# Altium project GimbalController.PrjPcb
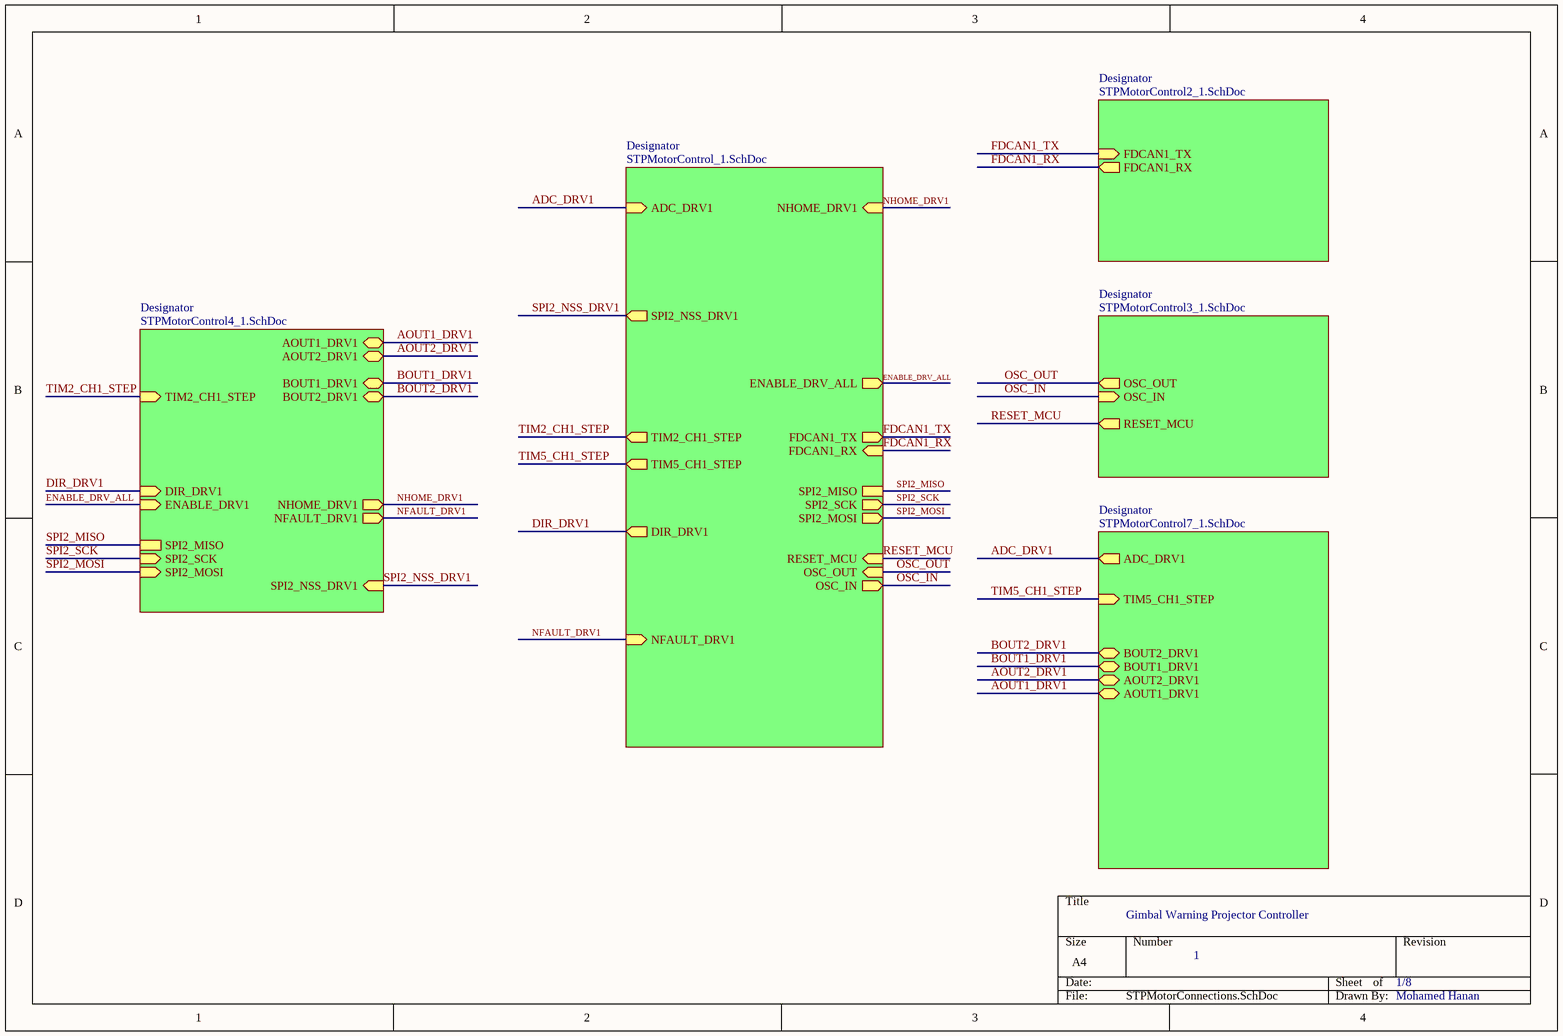
[diagram p0: STPMotorConnections.SchDoc]
6 sheets, 82 parts. Net scope: hierarchical (ports join the sheet entries above them; power ports are global).
Board file: STPMotorControl_1.PcbDoc
Sheets:
  STPMotorConnections.SchDoc
    Designator = STPMotorControl_1.SchDoc
    Designator = STPMotorControl2_1.SchDoc
    Designator = STPMotorControl3_1.SchDoc
    Designator = STPMotorControl4_1.SchDoc
    Designator = STPMotorControl7_1.SchDoc

## Sheet STPMotorConnections.SchDoc
size A4; SheetNumber: 1; SheetTotal: 6

### Sub-sheets
Designator = STPMotorControl_1.SchDoc: TIM2_CH1_STEP (out), TIM5_CH1_STEP (out), DIR_DRV1 (out), NFAULT_DRV1 (in), NHOME_DRV1 (in), ENABLE_DRV_ALL (out), FDCAN1_TX (out), FDCAN1_RX (in), SPI2_MISO, SPI2_SCK (out), SPI2_MOSI (out), RESET_MCU (in), OSC_OUT (in), OSC_IN (out), ADC_DRV1 (in), SPI2_NSS_DRV1 (out)
Designator = STPMotorControl2_1.SchDoc: FDCAN1_TX (in), FDCAN1_RX (out)
Designator = STPMotorControl3_1.SchDoc: OSC_OUT (out), OSC_IN (in), RESET_MCU (out)
Designator = STPMotorControl4_1.SchDoc: AOUT1_DRV1 (bidir), AOUT2_DRV1 (bidir), BOUT1_DRV1 (bidir), BOUT2_DRV1 (bidir), NHOME_DRV1 (out), NFAULT_DRV1 (out), SPI2_MISO, SPI2_SCK (in), SPI2_MOSI (in), DIR_DRV1 (in), ENABLE_DRV1 (in), TIM2_CH1_STEP (in), SPI2_NSS_DRV1 (in)
Designator = STPMotorControl7_1.SchDoc: BOUT2_DRV1 (bidir), BOUT1_DRV1 (bidir), AOUT2_DRV1 (bidir), AOUT1_DRV1 (bidir), ADC_DRV1 (out), TIM5_CH1_STEP (in)

### Nets
ADC_DRV1: sheet Designator/ADC_DRV1, sheet Designator/ADC_DRV1
AOUT1_DRV1: sheet Designator/AOUT1_DRV1, sheet Designator/AOUT1_DRV1
AOUT2_DRV1: sheet Designator/AOUT2_DRV1, sheet Designator/AOUT2_DRV1
BOUT1_DRV1: sheet Designator/BOUT1_DRV1, sheet Designator/BOUT1_DRV1
BOUT2_DRV1: sheet Designator/BOUT2_DRV1, sheet Designator/BOUT2_DRV1
DIR_DRV1: sheet Designator/DIR_DRV1, sheet Designator/DIR_DRV1
ENABLE_DRV_ALL: sheet Designator/ENABLE_DRV_ALL, sheet Designator/ENABLE_DRV1
FDCAN1_RX: sheet Designator/FDCAN1_RX, sheet Designator/FDCAN1_RX
FDCAN1_TX: sheet Designator/FDCAN1_TX, sheet Designator/FDCAN1_TX
NFAULT_DRV1: sheet Designator/NFAULT_DRV1, sheet Designator/NFAULT_DRV1
NHOME_DRV1: sheet Designator/NHOME_DRV1, sheet Designator/NHOME_DRV1
OSC_IN: sheet Designator/OSC_IN, sheet Designator/OSC_IN
OSC_OUT: sheet Designator/OSC_OUT, sheet Designator/OSC_OUT
RESET_MCU: sheet Designator/RESET_MCU, sheet Designator/RESET_MCU  [project net RESET]
SPI2_MISO: sheet Designator/SPI2_MISO, sheet Designator/SPI2_MISO
SPI2_MOSI: sheet Designator/SPI2_MOSI, sheet Designator/SPI2_MOSI
SPI2_NSS_DRV1: sheet Designator/SPI2_NSS_DRV1, sheet Designator/SPI2_NSS_DRV1
SPI2_SCK: sheet Designator/SPI2_SCK, sheet Designator/SPI2_SCK
TIM2_CH1_STEP: sheet Designator/TIM2_CH1_STEP, sheet Designator/TIM2_CH1_STEP
TIM5_CH1_STEP: sheet Designator/TIM5_CH1_STEP, sheet Designator/TIM5_CH1_STEP

### Notes on the sheet
- Gimbal Warning Projector Controller
- 1
- 1/8
- Mohamed Hanan

## Sheet STPMotorControl_1.SchDoc
size A4; SheetNumber: 2; SheetTotal: 6
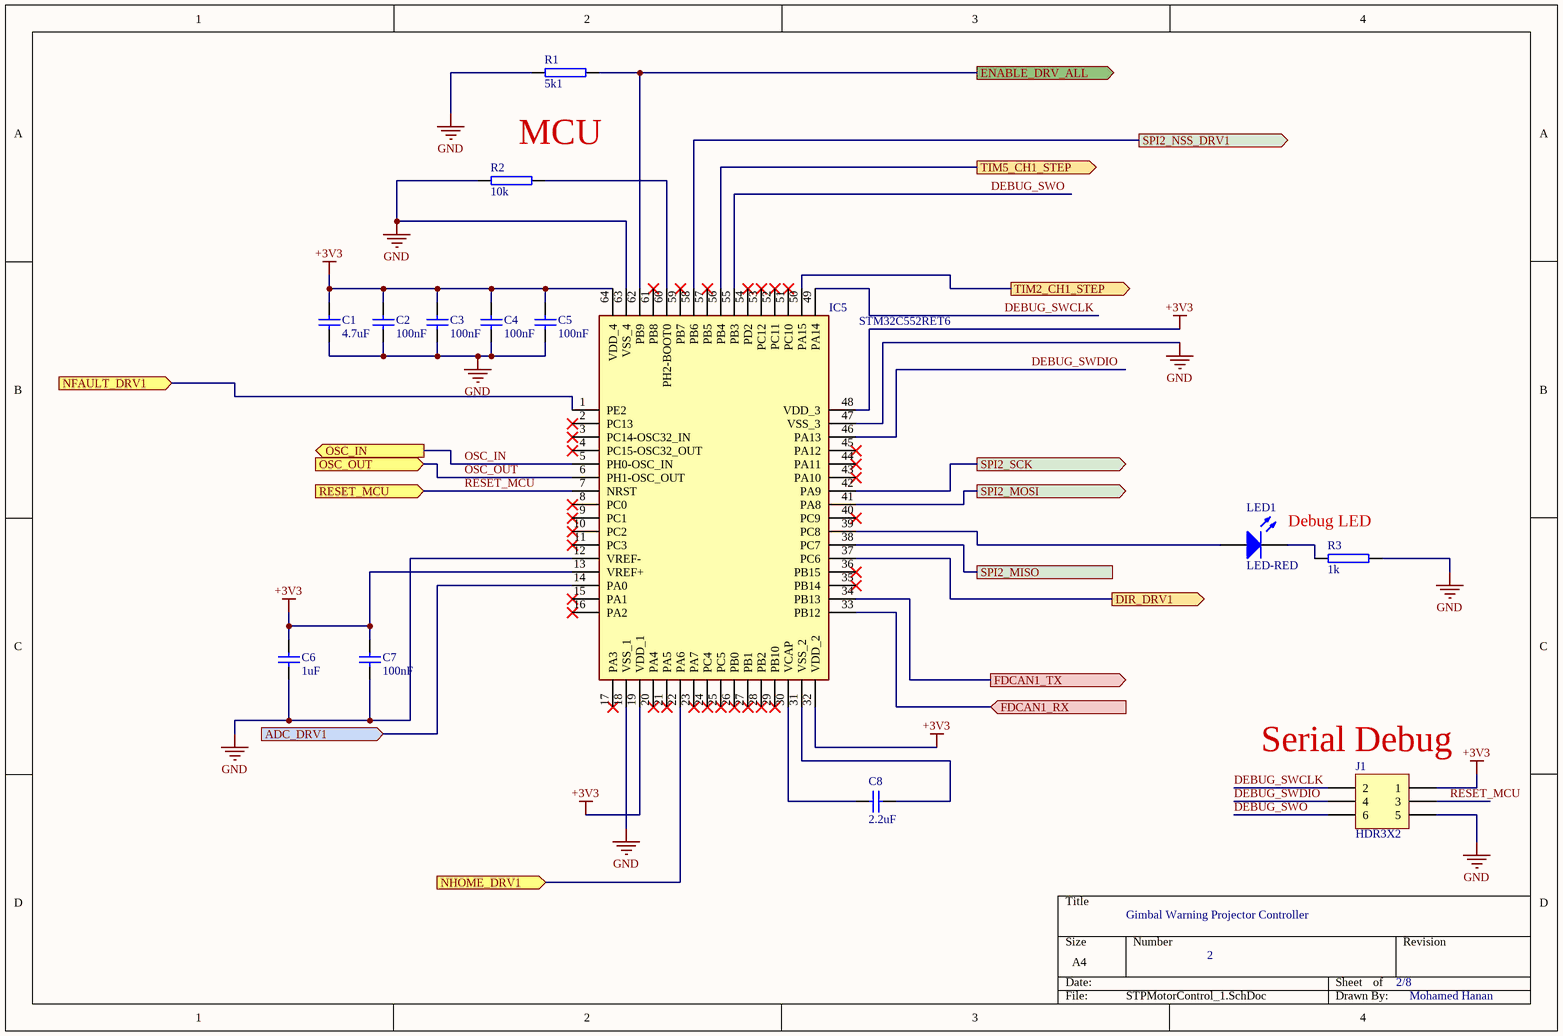
[diagram p1: STPMotorControl_1.SchDoc]

### Parts
C1  4.7uF  [CAP_1206]
C2  100nF  [CAP_0805]
C3  100nF  [CAP_0805]
C4  100nF  [CAP_0805]
C5  100nF  [CAP_0805]
C6  1uF  [CAP_0805]
C7  100nF  [CAP_0805]
C8  2.2uF  [CAP_0805]
IC5  STM32C552RET6  [QFP50P1200X1200X160-64N]
J1  HDR3X2  [HDR2X3_AUT]
LED1  LED-RED  [LED1206R]
R1  5k1  [RES_0805]
R2  10k  [RES_0805]
R3  1k  [RES_1206]

### Ports
ADC_DRV1 (in, see STPMotorConnections[2A], STPMotorControl7_1[1A]), DIR_DRV1 (out, see STPMotorConnections[2C], STPMotorControl4_1[2B]), ENABLE_DRV_ALL (out, see STPMotorConnections[3B]), FDCAN1_RX (in, see STPMotorConnections[3B], STPMotorControl2_1[1B]), FDCAN1_TX (out, see STPMotorConnections[3B], STPMotorControl2_1[2B]), NFAULT_DRV1 (in, see STPMotorConnections[2C], STPMotorControl4_1[2C]), NHOME_DRV1 (in, see STPMotorConnections[3A], STPMotorControl4_1[2C]), OSC_IN (out, see STPMotorConnections[3C], STPMotorControl3_1[1C]), OSC_OUT (in, see STPMotorConnections[3C], STPMotorControl3_1[2B]), RESET_MCU (in, see STPMotorConnections[3C], STPMotorControl3_1[1D]), SPI2_MISO (see STPMotorConnections[3B], STPMotorControl4_1[3C]), SPI2_MOSI (out, see STPMotorConnections[3C], STPMotorControl4_1[3C]), SPI2_NSS_DRV1 (out, see STPMotorConnections[2B], STPMotorControl4_1[2B]), SPI2_SCK (out, see STPMotorConnections[3B], STPMotorControl4_1[3C]), TIM2_CH1_STEP (out, see STPMotorConnections[2B], STPMotorControl4_1[3B]), TIM5_CH1_STEP (out, see STPMotorConnections[2B], STPMotorControl7_1[1B])

### Nets
+3V3: C1.2 C2.2 C3.2 C4.2 C5.2 C6.2 C7.2 IC5.13(VREF+) IC5.19(VDD_1) IC5.32(VDD_2) IC5.48(VDD_3) IC5.64(VDD_4) J1.1
GND: C1.1 C2.1 C3.1 C4.1 C5.1 C6.1 C7.1 IC5.12(VREF-) IC5.18(VSS_1) IC5.47(VSS_3) IC5.63(VSS_4) J1.5 R1.1 R2.1 R3.2
ADC_DRV1: IC5.14(PA0) ; port ADC_DRV1
DEBUG_SWCLK: IC5.49(PA14) J1.2
DEBUG_SWDIO: IC5.46(PA13) J1.4
DEBUG_SWO: IC5.55(PB3) J1.6
DIR_DRV1: IC5.37(PC6) ; port DIR_DRV1
ENABLE_DRV_ALL: IC5.62(PB9) R1.2 ; port ENABLE_DRV_ALL
FDCAN1_RX: IC5.33(PB12) ; port FDCAN1_RX
FDCAN1_TX: IC5.34(PB13) ; port FDCAN1_TX
NFAULT_DRV1: IC5.1(PE2) ; port NFAULT_DRV1
NHOME_DRV1: IC5.22(PA6) ; port NHOME_DRV1
OSC_IN: IC5.5(PH0-OSC_IN) ; port OSC_IN
OSC_OUT: IC5.6(PH1-OSC_OUT) ; port OSC_OUT
RESET_MCU: IC5.7(NRST) J1.3 ; port RESET_MCU  [project net RESET]
SPI2_MISO: IC5.38(PC7) ; port SPI2_MISO
SPI2_MOSI: IC5.41(PA8) ; port SPI2_MOSI
SPI2_NSS_DRV1: IC5.58(PB6) ; port SPI2_NSS_DRV1
SPI2_SCK: IC5.42(PA9) ; port SPI2_SCK
TIM2_CH1_STEP: IC5.50(PA15) ; port TIM2_CH1_STEP
TIM5_CH1_STEP: IC5.56(PB4) ; port TIM5_CH1_STEP
NetC8_1: C8.1 IC5.30(VCAP)
NetC8_2: C8.2 IC5.31(VSS_2)
NetIC5_39: IC5.39(PC8) LED1.A
NetIC5_60: IC5.60(PH2-BOOT0) R2.2
NetLED1_K: LED1.K R3.1

Not connected (* = marked no-connect by the designer): IC5 2(PC13)* 3(PC14-OSC32_IN)* 4(PC15-OSC32_OUT)* 8(PC0)* 9(PC1)* 10(PC2)* 11(PC3)* 15(PA1)* 16(PA2)* 17(PA3)* 20(PA4)* 21(PA5)* 23(PA7)* 24(PC4)* 25(PC5)* 26(PB0)* 27(PB1)* 28(PB2)* 29(PB10)* 35(PB14)* 36(PB15)* 40(PC9)* 43(PA10)* 44(PA11)* 45(PA12)* 51(PC10)* 52(PC11)* 53(PC12)* 54(PD2)* 57(PB5)* 59(PB7)* 61(PB8)*

### Notes on the sheet
- MCU
- Debug LED
- (near J1) Serial Debug
- Gimbal Warning Projector Controller
- 2
- 2/8
- Mohamed Hanan

### Library data of the parts
C1 = CAPN 1206: Non Polarized Capacitor, SMD, 1206
C2-C8 = CAPN 0805: Non Polarized Capacitor, SMD, 0805
IC5 = STM32C552RET6: Integrated Circuit; Manufacturer_Name: STMicroelectronics; Datasheet Link: https://www.st.com/resource/en/datasheet/stm32c551cc.pdf; Height: 1.6mm; Manufacturer_Part_Number: STM32C552RET6
J1 = HDR3X2: Header, 3-Pin, Dual row, 2.54mm Pitch, Straight; Supplier 1: Farnell; Supplier Part Number 1: 9733574
LED1 = SMD 1206 LED-RED: RED LED, Case 1206; Supplier 1: Farnell; Supplier Part Number 1: 8530017
R1 R2 = Resistor 0805: Resistor, SMD, 0805
R3 = Resistor 1206: Resistor, SMD, 1206

## Sheet STPMotorControl2_1.SchDoc
size A4; SheetNumber: 3; SheetTotal: 6
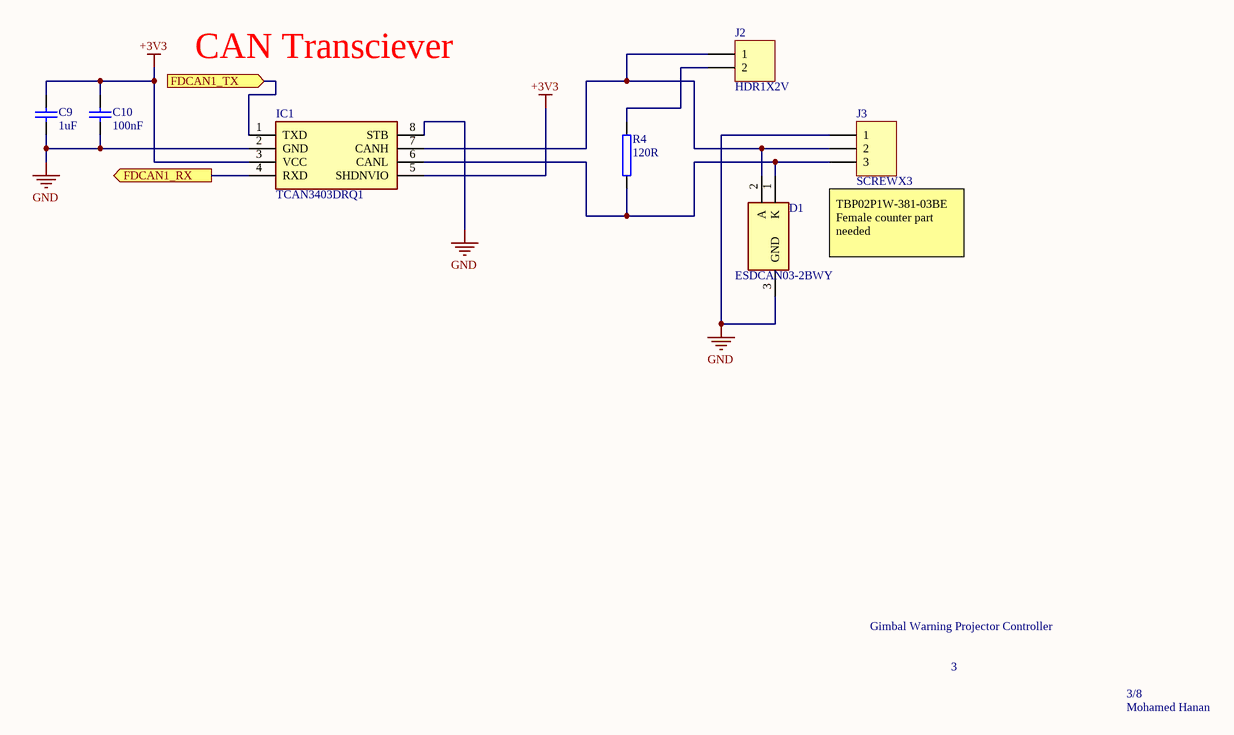
[diagram p2: STPMotorControl2_1.SchDoc]

### Parts
C9  1uF  [CAP_0805]
C10  100nF  [CAP_0805]
D1  ESDCAN03-2BWY  [SOT65P210X110-3N]
IC1  TCAN3403DRQ1  [SOIC127P600X175-8N]
J2  HDR1X2V  [HDR1X2_AUT]
J3  SCREWX3  [SCREW3_AUT]
R4  120R  [RES_1206]

### Ports
FDCAN1_RX (out, see STPMotorConnections[3A], STPMotorControl_1[3C]), FDCAN1_TX (in, see STPMotorConnections[3A], STPMotorControl_1[3C])

### Nets
+3V3: C9.2 C10.2 IC1.3(VCC) IC1.5(SHDNVIO)
GND: C9.1 C10.1 D1.3(GND) IC1.2(GND) IC1.8(STB) J3.1
FDCAN1_RX: IC1.4(RXD) ; port FDCAN1_RX
FDCAN1_TX: IC1.1(TXD) ; port FDCAN1_TX
NetD1_1: D1.1(K) IC1.6(CANL) J3.3 R4.1
NetD1_2: D1.2(A) IC1.7(CANH) J2.1 J3.2
NetJ2_2: J2.2 R4.2

### Notes on the sheet
- CAN Transciever
- (near J3) TBP02P1W-381-03BE
  Female counter part needed
- Gimbal Warning Projector Controller
- 3
- 3/8
- Mohamed Hanan

### Library data of the parts
C9 C10 = CAPN 0805: Non Polarized Capacitor, SMD, 0805
D1 = ESDCAN03-2BWY: TVS Diode (Uni-directional); Manufacturer_Name: STMicroelectronics; Datasheet Link: https://www.st.com/resource/en/datasheet/esdcan03-2bwy.pdf; Height: 1.1mm; Manufacturer_Part_Number: ESDCAN03-2BWY; Mouser Part Number: 511-ESDCAN03-2BWY; Mouser Price/Stock: https://www.mouser.co.uk/ProductDetail/STMicroelectronics/ESDCAN03-2BWY?qs=FqY30PPN9V2iiokjuqa22Q%3D%3D; Arrow Part Number: ESDCAN03-2BWY; Arrow Price/Stock: https://www.arrow.com/en/products/esdcan03-2bwy/stmicroelectronics.html?utm_currency=USD&region=europe
IC1 = TCAN3403DRQ1: Integrated Circuit; Manufacturer_Name: Texas Instruments; Datasheet Link: https://www.ti.com/lit/ds/symlink/tcan3403-q1.pdf?ts=1732780388772&ref_url=https%253A%252F%252Fwww.ti.com%252Fproduct%252FTCAN3403-Q1%252Fpart-details%252FTCAN3403DRQ1; Height: 1.75mm; Manufacturer_Part_Number: TCAN3403DRQ1; Mouser Part Number: 595-TCAN3403DRQ1; Mouser Price/Stock: https://www.mouser.co.uk/ProductDetail/Texas-Instruments/TCAN3403DRQ1?qs=VVKQmw408U8i3BeOClYB9g%3D%3D; Arrow Part Number: TCAN3403DRQ1; Arrow Price/Stock: https://www.arrow.com/en/products/tcan3403drq1/texas-instruments?utm_currency=USD&region=nac
J2 = HDR1X2V: Header, Plug, 2.54mm, 2 Pins, Straight; Supplier 1: Farnell; Supplier Part Number 1: 2254030
J3 = SCREWX3: Terminal Block, PCB, 3Way, Pitch 5mm; Supplier 1: Farnell; Supplier Part Number 1: 9632689
R4 = Resistor 1206: Resistor, SMD, 1206

## Sheet STPMotorControl3_1.SchDoc
size A4; SheetNumber: 4; SheetTotal: 6
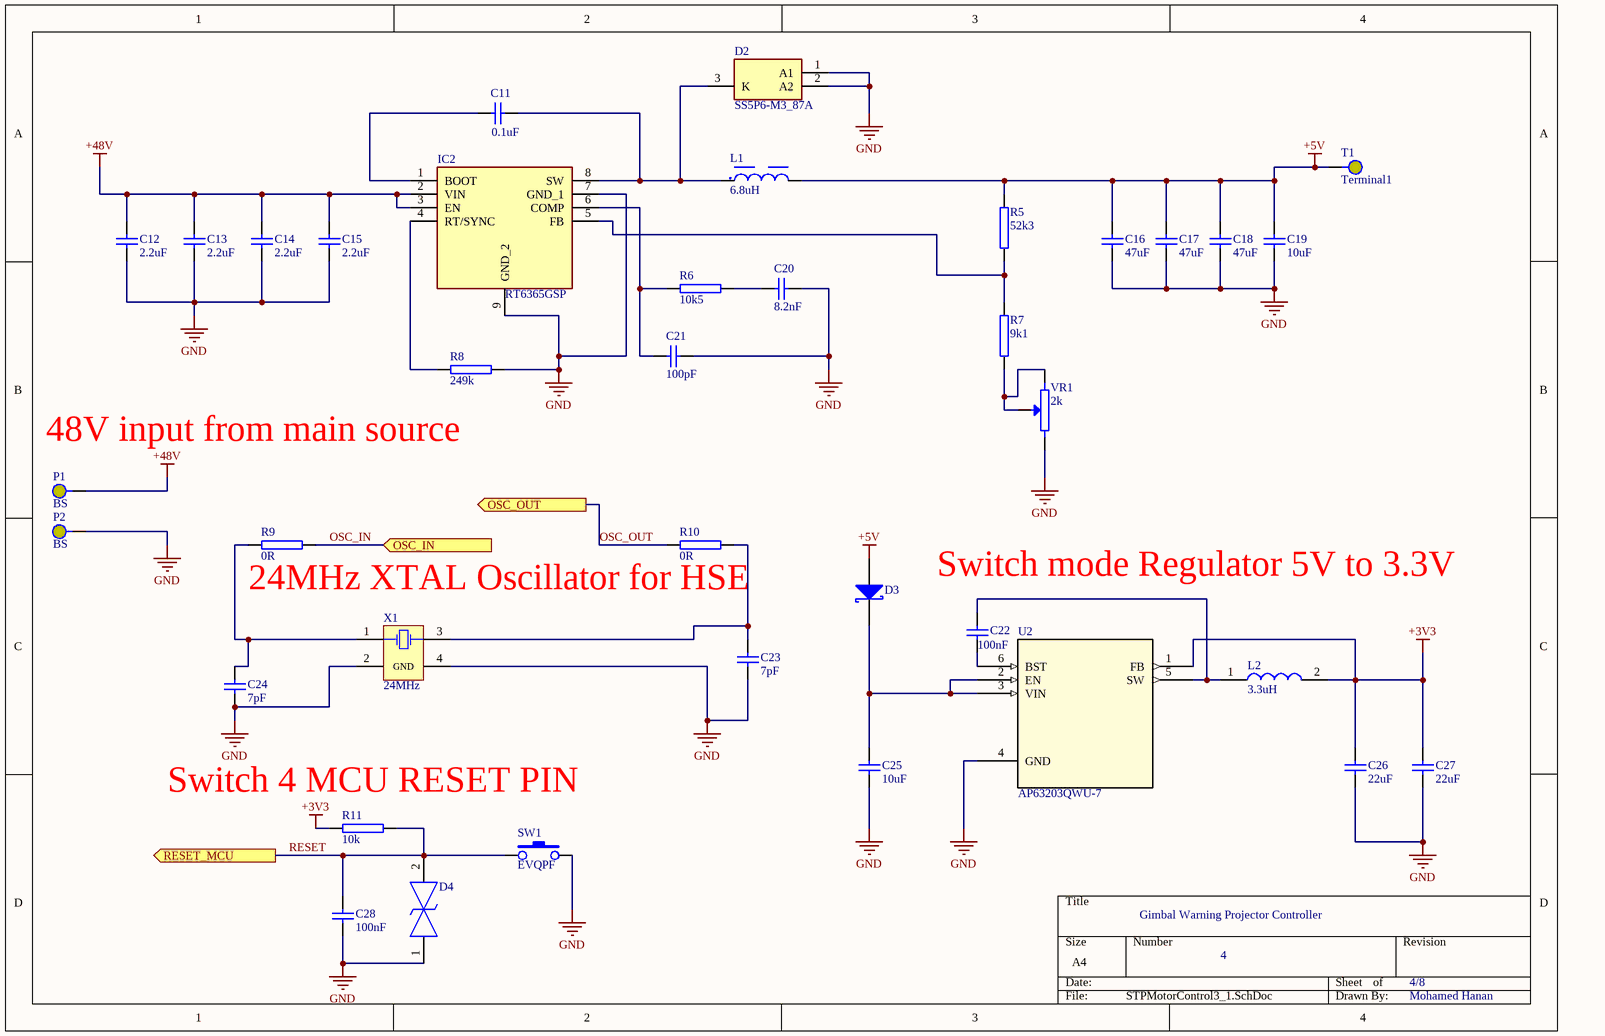
[diagram p3: STPMotorControl3_1.SchDoc]

### Parts
C11  0.1uF  [CAP_1206]
C12  2.2uF  [CAP_0805]
C13  2.2uF  [CAP_0805]
C14  2.2uF  [CAP_0805]
C15  2.2uF  [CAP_0805]
C16  47uF  [CAP_1206]
C17  47uF  [CAP_1206]
C18  47uF  [CAP_1206]
C19  10uF  [CAP_1206]
C20  8.2nF  [CAP_1206]
C21  100pF  [CAP_0805]
C22  100nF  [CAP_0805]
C23  7pF  [CAP_0805]
C24  7pF  [CAP_0805]
C25  10uF  [CAP_1206]
C26  22uF  [CAP_1206]
C27  22uF  [CAP_1206]
C28  100nF  [CAP_0805]
D2  SS5P6-M3_87A  [SS5P6M387A]
D3  PMEG3050BEP  [SOD-128]  (value not drawn)
D4  TSD05CDYFR  [SOD2613X100N]  (value not drawn)
IC2  RT6365GSP  [SOIC127P600X175-9N]
L1  6.8uH  [WE-LHMI_7050]
L2  3.3uH  [SRP4020TA3R3M]
P1  BS  [Banana_AUT]
P2  BS  [Banana_AUT]
R5  52k3  [RES_0805]
R6  10k5  [RES_0805]
R7  9k1  [RES_0805]
R8  249k  [RES_1206]
R9  0R  [RES_0805]
R10  0R  [RES_0805]
R11  10k  [RES_0805]
SW1  EVQPF  [EVQPF203M]
T1  Terminal1  [PAD1_AUT]
U2  AP63203QWU-7  [TSOT26_DIO]
VR1  2k  [3362S]
X1  24MHz  [CX2520SB]

### Ports
OSC_IN (in, see STPMotorConnections[3B], STPMotorControl_1[1B]), OSC_OUT (out, see STPMotorConnections[3B], STPMotorControl_1[1B]), RESET_MCU (out, see STPMotorConnections[3B], STPMotorControl_1[1B])

### Nets
+3V3: C26.2 C27.2 L2.2 R11.2 U2.1(FB)
+5V: C16.2 C17.2 C18.2 C19.2 D3.A L1.2 R5.2 T1.1
+48V: C12.2 C13.2 C14.2 C15.2 IC2.2(VIN) IC2.3(EN) P1.1
GND: C12.1 C13.1 C14.1 C15.1 C16.1 C17.1 C18.1 C19.1 C20.2 C21.2 C23.2 C24.2 C25.1 C26.1 C27.1 C28.1 D2.1(A1) D2.2(A2) D4.1 IC2.7(GND_1) IC2.9(GND_2) P2.1 R8.2 SW1.2 U2.4(GND) VR1.2(BOT) X1.2(GND) X1.4(GND)
OSC_IN: R9.2 ; port OSC_IN
OSC_OUT: R10.1 ; port OSC_OUT
RESET: C28.2 D4.2 R11.1 SW1.1 ; port RESET_MCU
NetC11_1: C11.1 IC2.1(BOOT)
NetC11_2: C11.2 D2.3(K) IC2.8(SW) L1.1
NetC20_1: C20.1 R6.2
NetC21_1: C21.1 IC2.6(COMP) R6.1
NetC22_1: C22.1 U2.6(BST)
NetC22_2: C22.2 L2.1 U2.5(SW)
NetC23_1: C23.1 R10.2 X1.3(OSC2)
NetC24_1: C24.1 R9.1 X1.1(OSC1)
NetC25_2: C25.2 D3.K U2.2(EN) U2.3(VIN)
NetIC2_4: IC2.4(RT/SYNC) R8.1
NetIC2_5: IC2.5(FB) R5.1 R7.2
NetR7_1: R7.1 VR1.1(TOP) VR1.W(TAP)

### Notes on the sheet
- 48V input from main source
- (near C22) Switch mode Regulator 5V to 3.3V
- 24MHz XTAL Oscillator for HSE
- (near R11) Switch 4 MCU RESET PIN
- Gimbal Warning Projector Controller
- 4
- 4/8
- Mohamed Hanan

### Library data of the parts
C11 C16-C20 C25-C27 = CAPN 1206: Non Polarized Capacitor, SMD, 1206
C12-C15 C21-C24 C28 = CAPN 0805: Non Polarized Capacitor, SMD, 0805
D2 = SS5P6-M3_87A: Schottky Diode; Manufacturer_Name: Vishay; Manufacturer_Part_Number: SS5P6-M3/87A; Datasheet Link: https://www.vishay.com/docs/88988/ss5p6.pdf; Height: 1.2mm; Mouser Part Number: 625-SS5P6-M3/87A; Mouser Price/Stock: https://www.mouser.co.uk/ProductDetail/Vishay-General-Semiconductor/SS5P6-M3-87A?qs=XGzIaZb%2FFYLx0h%2FWoI%2FVUQ%3D%3D; Arrow Part Number: SS5P6-M3/87A; Arrow Price/Stock: https://www.arrow.com/en/products/ss5p6-m387a/vishay?utm_currency=USD&region=nac
D3 = PMEG3050BEP: Schottky REC, 30V, 5A, SMD; Supplier 1: Farnell; Supplier Part Number 1: 1829196
D4 = TSD05CDYFR: TVS Diode (Bi-directional); Manufacturer_Name: Texas Instruments; Datasheet Link: https://www.ti.com/lit/ds/symlink/tsd05c.pdf?ts=1691730725852&ref_url=https%253A%252F%252Fwww.ti.com%252Fproduct%252FTSD05C%253FkeyMatch%253DTSD05CDYFR%2526tisearch%253Dsearch-everything%2526usecase%253DOPN; Height: 1mm; Manufacturer_Part_Number: TSD05CDYFR; Mouser Part Number: 595-TSD05CDYFR; Mouser Price/Stock: https://www.mouser.co.uk/ProductDetail/Texas-Instruments/TSD05CDYFR?qs=Imq1NPwxi74wAiGFX0POZQ%3D%3D; Arrow Part Number: TSD05CDYFR; Arrow Price/Stock: https://www.arrow.com/en/products/tsd05cdyfr/texas-instruments.html?utm_currency=USD&region=nac
IC2 = RT6365GSP: Integrated Circuit; Manufacturer_Name: RICHTEK; Datasheet Link: https://www.richtek.com/assets/product_file/RT6365/DS6365-02.pdf; Height: 1.753mm; Manufacturer_Part_Number: RT6365GSP; Mouser Part Number: 835-RT6365GSP; Mouser Price/Stock: https://www.mouser.co.uk/ProductDetail/Richtek/RT6365GSP?qs=amGC7iS6iy%252BGHkAL3RFUug%3D%3D
L1 = WE-LHMI_7050: Power Inductor, 6.8Uh, Shielded, 6.6A Rohs Compliant: Yes |Wurth Elektronik 7443734948068; MF: Wurth Electronics; SnapEDA_Link: https://www.snapeda.com/parts/7443734948068/Wurth+Electronics/view-part/?ref=snap; Package: None; Value: *; MP: 7443734948068; Check_prices: https://www.snapeda.com/parts/7443734948068/Wurth+Electronics/view-part/?ref=eda
L2 = SRP4020TA-3R3M: Inductor; Manufacturer_Name: Bourns; Datasheet Link: https://www.bourns.com/docs/Product-Datasheets/SRP4020TA.pdf; Height: 2mm; Manufacturer_Part_Number: SRP4020TA-3R3M; Mouser Part Number: 652-SRP4020TA-3R3M; Mouser Price/Stock: https://www.mouser.co.uk/ProductDetail/Bourns/SRP4020TA-3R3M?qs=Ph8%2FHnX6CQx4K7XcRwo6CA%3D%3D; Arrow Part Number: SRP4020TA-3R3M; Arrow Price/Stock: https://www.arrow.com/en/products/srp4020ta-3r3m/bourns?region=nac
P1 P2 = Banana Socket: Banana Socket, 4mm, Panel, Black, 10A; Supplier 1: Farnell; Supplier Part Number 1: 1101113
R5-R7 R9-R11 = Resistor 0805: Resistor, SMD, 0805
R8 = Resistor 1206: Resistor, SMD, 1206
SW1 = EVQPF: PANASONIC  EVQPF203M  SWITCH, TACTILE, SPST-NO, 20mA, 15VDC; Supplier 1: Farnell; Supplier Part Number 1: 2079505
T1 = Terminal1: Terminal, Pad 70x70mil, Hole 32 mil
U2 = AP63203QWU-7: Description; Manufacturer_Name: Diodes Inc; Type: Power Management; Copyright: Copyright (C) 2026 Ultra Librarian. All rights reserved.; Manufacturer_Part_Number: AP63203QWU-7; RefDes: RefDes
VR1 = 3362S-1-202LF: 3362S Series, 1/4 ” Square  Potentiometer, 2k, 10%, 0.5 Watts, 1Turn; Supplier 1: Farnell; Supplier Part Number 1: 2321842
X1 = CX2520SB24000D0FLJZZ: Crystals, 24MHz; Supplier 1: Farnell; Supplier Part Number 1: 1657889

## Sheet STPMotorControl4_1.SchDoc
size A4; SheetNumber: 5; SheetTotal: 6
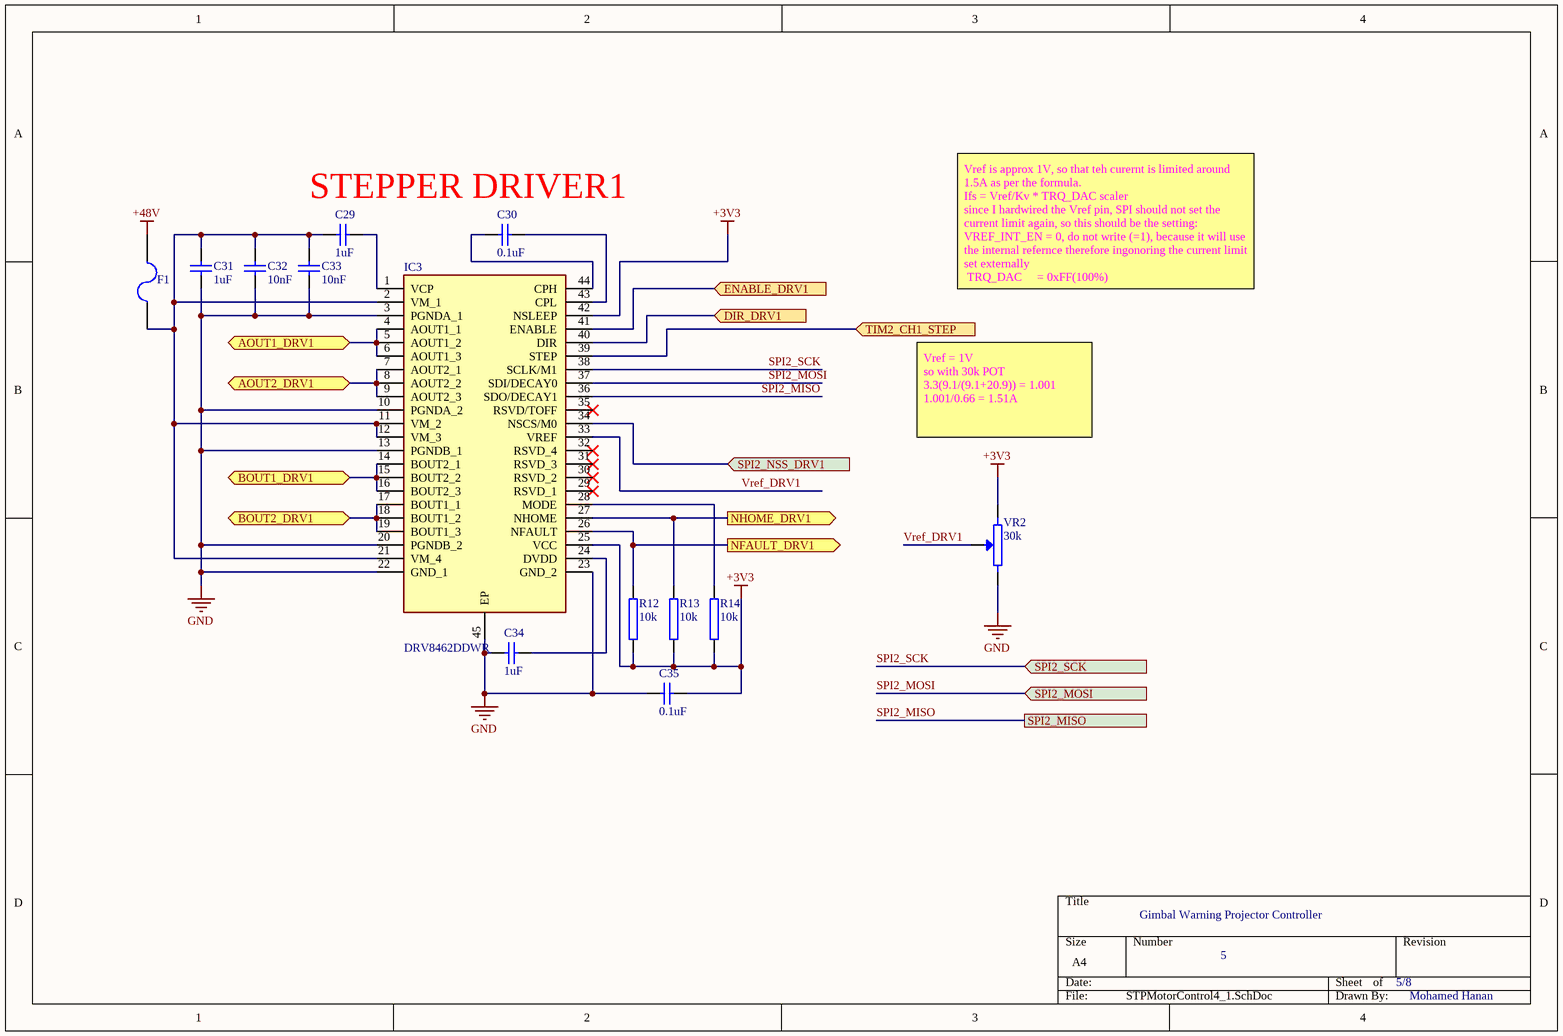
[diagram p4: STPMotorControl4_1.SchDoc]

### Parts
C29  1uF  [CAP_0805]
C30  0.1uF  [CAP_1206]
C31  1uF  [CAP_0805]
C32  10nF  [CAP_0805]
C33  10nF  [CAP_0805]
C34  1uF  [CAP_0805]
C35  0.1uF  [CAP_1206]
F1  1206L035/16YR  [MC36207]  (value not drawn)
IC3  DRV8462DDWR  [SOP64P810X120-45N]
R12  10k  [RES_0805]
R13  10k  [RES_0805]
R14  10k  [RES_0805]
VR2  30k  [3362S]

### Ports
AOUT1_DRV1 (bidir, see STPMotorConnections[1B], STPMotorControl7_1[1C]), AOUT2_DRV1 (bidir, see STPMotorConnections[1B], STPMotorControl7_1[1C]), BOUT1_DRV1 (bidir, see STPMotorConnections[1B], STPMotorControl7_1[1C]), BOUT2_DRV1 (bidir, see STPMotorConnections[1B], STPMotorControl7_1[1C]), DIR_DRV1 (in, see STPMotorConnections[1B], STPMotorControl_1[3C]), ENABLE_DRV1 (in, see STPMotorConnections[1B]), NFAULT_DRV1 (out, see STPMotorConnections[1C], STPMotorControl_1[1B]), NHOME_DRV1 (out, see STPMotorConnections[1B], STPMotorControl_1[2D]), SPI2_MISO (see STPMotorConnections[1C], STPMotorControl_1[3C]), SPI2_MOSI (in, see STPMotorConnections[1C], STPMotorControl_1[3B]), SPI2_NSS_DRV1 (in, see STPMotorConnections[1C], STPMotorControl_1[3A]), SPI2_SCK (in, see STPMotorConnections[1C], STPMotorControl_1[3B]), TIM2_CH1_STEP (in, see STPMotorConnections[1B], STPMotorControl_1[3B])

### Nets
+3V3: C35.2 IC3.25(VCC) IC3.42(NSLEEP) R12.1 R13.1 R14.1 VR2.1(TOP)
+48V: F1.2
GND: C31.1 C32.1 C33.1 C34.2 C35.1 IC3.3(PGNDA_1) IC3.10(PGNDA_2) IC3.13(PGNDB_1) IC3.20(PGNDB_2) IC3.22(GND_1) IC3.23(GND_2) IC3.45(EP) VR2.2(BOT)
AOUT1_DRV1: IC3.4(AOUT1_1) IC3.5(AOUT1_2) IC3.6(AOUT1_3) ; port AOUT1_DRV1
AOUT2_DRV1: IC3.7(AOUT2_1) IC3.8(AOUT2_2) IC3.9(AOUT2_3) ; port AOUT2_DRV1
BOUT1_DRV1: IC3.14(BOUT2_1) IC3.15(BOUT2_2) IC3.16(BOUT2_3) ; port BOUT1_DRV1
BOUT2_DRV1: IC3.17(BOUT1_1) IC3.18(BOUT1_2) IC3.19(BOUT1_3) ; port BOUT2_DRV1
DIR_DRV1: IC3.40(DIR) ; port DIR_DRV1
ENABLE_DRV_ALL: IC3.41(ENABLE) ; port ENABLE_DRV1
NFAULT_DRV1: IC3.26(NFAULT) R12.2 ; port NFAULT_DRV1
NHOME_DRV1: IC3.27(NHOME) R13.2 ; port NHOME_DRV1
SPI2_MISO: IC3.36(SDO/DECAY1) ; port SPI2_MISO
SPI2_MOSI: IC3.37(SDI/DECAY0) ; port SPI2_MOSI
SPI2_NSS_DRV1: IC3.34(NSCS/M0) ; port SPI2_NSS_DRV1
SPI2_SCK: IC3.38(SCLK/M1) ; port SPI2_SCK
TIM2_CH1_STEP: IC3.39(STEP) ; port TIM2_CH1_STEP
Vref_DRV1: IC3.33(VREF) VR2.W(TAP)
NetC29_1: C29.1 IC3.1(VCP)
NetC29_2: C29.2 C31.2 C32.2 C33.2 F1.1 IC3.2(VM_1) IC3.11(VM_2) IC3.12(VM_3) IC3.21(VM_4)
NetC30_1: C30.1 IC3.44(CPH)
NetC30_2: C30.2 IC3.43(CPL)
NetC34_1: C34.1 IC3.24(DVDD)
NetIC3_28: IC3.28(MODE) R14.2

Not connected (* = marked no-connect by the designer): IC3 29(RSVD_1)* 30(RSVD_2)* 31(RSVD_3)* 32(RSVD_4)* 35(RSVD/TOFF)*

### Notes on the sheet
- STEPPER DRIVER1
- Vref is approx 1V, so that teh curernt is limited around 1.5A as per the formula.
  Ifs = Vref/Kv * TRQ_DAC scaler
  since I hardwired the Vref pin, SPI should not set the current limit again, so this should be the setting:
  VREF_INT_EN = 0, do not write (=1), because it will use the internal refernce therefore ingonoring the current limit set externally
  TRQ_DAC     = 0xFF(100%)
- Vref = 1V
  so with 30k POT
  3.3(9.1/(9.1+20.9)) = 1.001
  1.001/0.66 = 1.51A
- Gimbal Warning Projector Controller
- 5
- 5/8
- Mohamed Hanan

### Library data of the parts
C29 C31-C34 = CAPN 0805: Non Polarized Capacitor, SMD, 0805
C30 C35 = CAPN 1206: Non Polarized Capacitor, SMD, 1206
F1 = 1206L035/16YR: Fuse, PTC Reset, 350mA Hold, 750mA Tripping, 16v; Supplier 1: Element14; Supplier Part Number 1: 1822203
IC3 = DRV8462DDWR: Integrated Circuit; Manufacturer_Name: Texas Instruments; Datasheet Link: https://www.ti.com/lit/gpn/drv8462; Height: 1.2mm; Manufacturer_Part_Number: DRV8462DDWR; Mouser Part Number: 595-DRV8462DDWR; Mouser Price/Stock: https://www.mouser.co.uk/ProductDetail/Texas-Instruments/DRV8462DDWR?qs=rQFj71Wb1eVexvYNsDfnvA%3D%3D; Arrow Part Number: DRV8462DDWR; Arrow Price/Stock: https://www.arrow.com/en/products/drv8462ddwr/texas-instruments?utm_currency=USD&region=nac
R12-R14 = Resistor 0805: Resistor, SMD, 0805
VR2 = 3362S-1-202LF: as VR1 on sheet STPMotorControl3_1; Supplier 1: Farnell; Supplier Part Number 1: 2321842

## Sheet STPMotorControl7_1.SchDoc
size A4; SheetNumber: 6; SheetTotal: 6
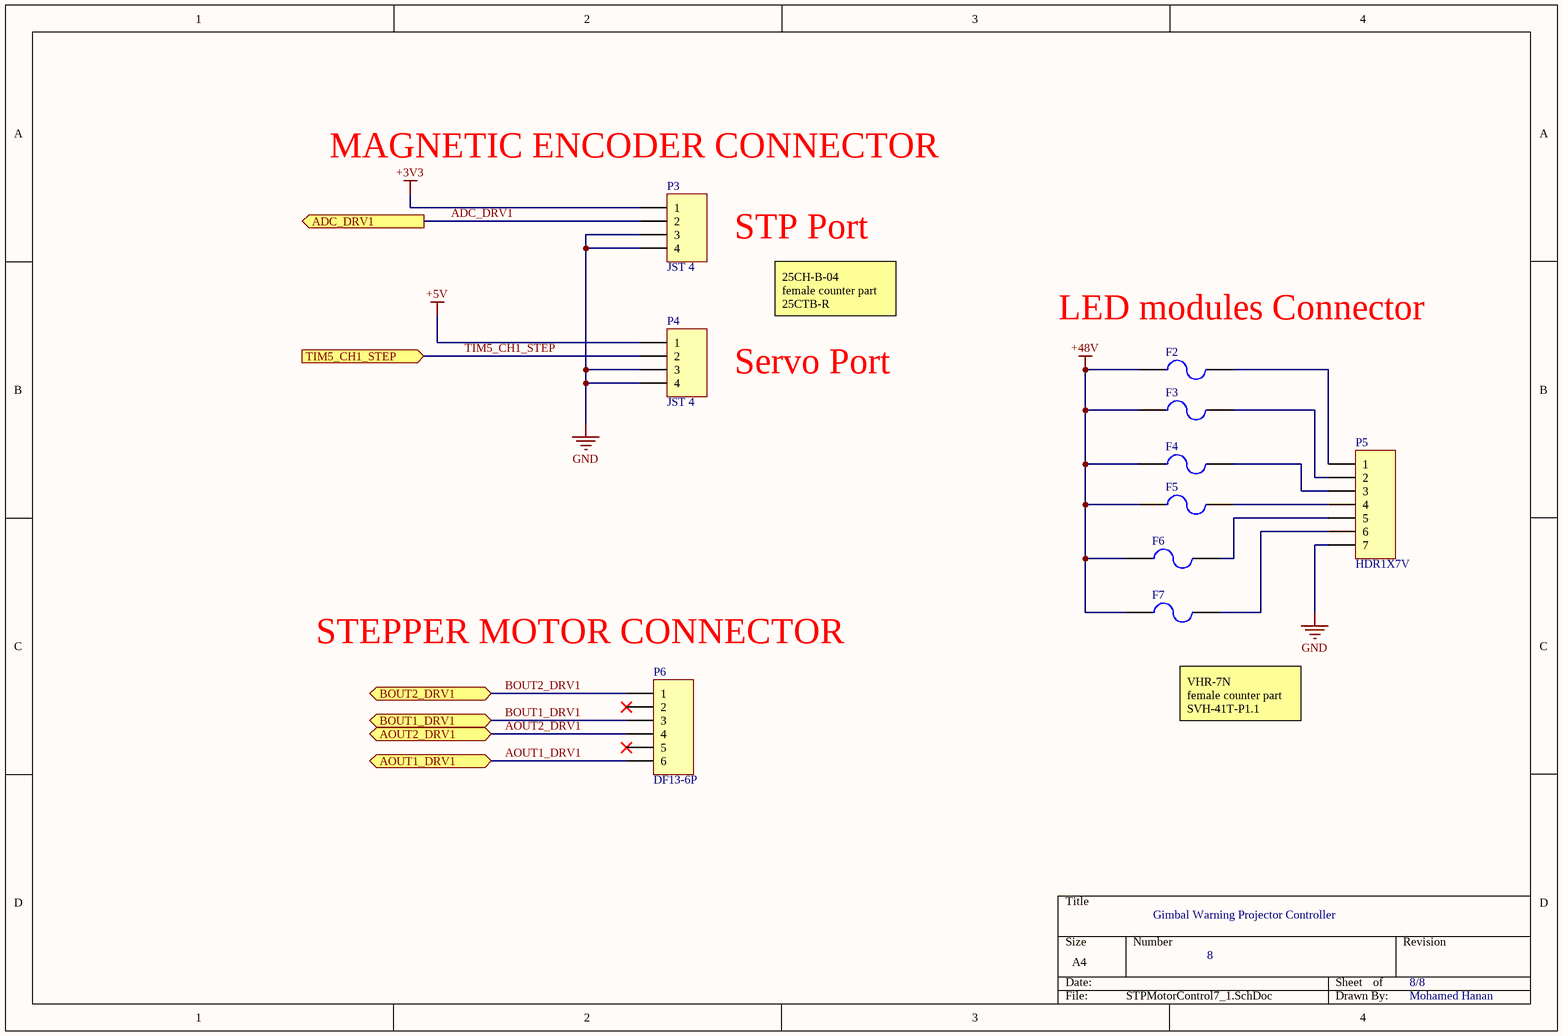
[diagram p5: STPMotorControl7_1.SchDoc]

### Parts
F2  1206L035/16YR  [MC36207]  (value not drawn)
F3  1206L035/16YR  [MC36207]  (value not drawn)
F4  1206L035/16YR  [MC36207]  (value not drawn)
F5  1206L035/16YR  [MC36207]  (value not drawn)
F6  1206L035/16YR  [MC36207]  (value not drawn)
F7  1206L035/16YR  [MC36207]  (value not drawn)
P3  JST 4  [XA-4]
P4  JST 4  [XA-4]
P5  HDR1X7V  [HDR1X7_AUT]
P6  DF13-6P  [DF13-6]

### Ports
ADC_DRV1 (out, see STPMotorConnections[3C], STPMotorControl_1[1C]), AOUT1_DRV1 (bidir, see STPMotorConnections[3C], STPMotorControl4_1[1B]), AOUT2_DRV1 (bidir, see STPMotorConnections[3C], STPMotorControl4_1[1B]), BOUT1_DRV1 (bidir, see STPMotorConnections[3C], STPMotorControl4_1[1B]), BOUT2_DRV1 (bidir, see STPMotorConnections[3C], STPMotorControl4_1[1C]), TIM5_CH1_STEP (in, see STPMotorConnections[3C], STPMotorControl_1[3A])

### Nets
+3V3: P3.1
+5V: P4.1
+48V: F2.1 F3.1 F4.1 F5.1 F6.1 F7.1
GND: P3.3 P3.4 P4.3 P4.4 P5.7
ADC_DRV1: P3.2 ; port ADC_DRV1
AOUT1_DRV1: P6.6 ; port AOUT1_DRV1
AOUT2_DRV1: P6.4 ; port AOUT2_DRV1
BOUT1_DRV1: P6.3 ; port BOUT1_DRV1
BOUT2_DRV1: P6.1 ; port BOUT2_DRV1
TIM5_CH1_STEP: P4.2 ; port TIM5_CH1_STEP
NetF2_2: F2.2 P5.1
NetF3_2: F3.2 P5.2
NetF4_2: F4.2 P5.3
NetF5_2: F5.2 P5.4
NetF6_2: F6.2 P5.5
NetF7_2: F7.2 P5.6

Not connected (* = marked no-connect by the designer): P6 2* 5*

### Notes on the sheet
- (near P3) MAGNETIC ENCODER CONNECTOR
- STP Port
- 25CH-B-04
  female counter part
  25CTB-R
- Servo Port
- (near F2) LED modules Connector
- (near P6) STEPPER MOTOR CONNECTOR
- VHR-7N
  female counter part
  SVH-41T-P1.1
- Gimbal Warning Projector Controller
- 8
- 8/8
- Mohamed Hanan

### Library data of the parts
F2-F7 = 1206L035/16YR: as F1 on sheet STPMotorControl4_1; Supplier 1: Element14; Supplier Part Number 1: 1822203
P3 P4 = JST XA Header 4: JST XA Header, 4-Pin, Pitch 2.5mm; Supplier 1: Farnell; Supplier Part Number 1: 9492089
P5 = HDR1X7V: Header, Plug, 2.54mm, 7 Pins, Straight; Supplier 1: Farnell; Supplier Part Number 1: 9731121
P6 = DF13-6P: HIROSE(HRS)  DF13-6P-1.25H(20)  Wire-To-Board Connector, Right Angle, DF13 Series, Surface Mount, Header, 6 Contacts, 1.25 mm; Supplier 1: Farnell; Supplier Part Number 1: 1324928

## Nets that join several sheets
+3V3: STPMotorControl_1 (13 pins), STPMotorControl2_1 (C9.2 C10.2 IC1.3 IC1.5), STPMotorControl3_1 (5 pins), STPMotorControl4_1 (7 pins), STPMotorControl7_1 (P3.1)
+5V: STPMotorControl3_1 (8 pins), STPMotorControl7_1 (P4.1)
+48V: STPMotorControl3_1 (7 pins), STPMotorControl4_1 (F1.2), STPMotorControl7_1 (6 pins)
GND: STPMotorControl_1 (15 pins), STPMotorControl2_1 (6 pins), STPMotorControl3_1 (28 pins), STPMotorControl4_1 (13 pins), STPMotorControl7_1 (5 pins)
ADC_DRV1: STPMotorControl_1 (IC5.14), STPMotorControl7_1 (P3.2)
AOUT1_DRV1: STPMotorControl4_1 (IC3.4 IC3.5 IC3.6), STPMotorControl7_1 (P6.6)
AOUT2_DRV1: STPMotorControl4_1 (IC3.7 IC3.8 IC3.9), STPMotorControl7_1 (P6.4)
BOUT1_DRV1: STPMotorControl4_1 (IC3.14 IC3.15 IC3.16), STPMotorControl7_1 (P6.3)
BOUT2_DRV1: STPMotorControl4_1 (IC3.17 IC3.18 IC3.19), STPMotorControl7_1 (P6.1)
DIR_DRV1: STPMotorControl_1 (IC5.37), STPMotorControl4_1 (IC3.40)
ENABLE_DRV_ALL: STPMotorControl_1 (IC5.62 R1.2), STPMotorControl4_1 (IC3.41)
FDCAN1_RX: STPMotorControl_1 (IC5.33), STPMotorControl2_1 (IC1.4)
FDCAN1_TX: STPMotorControl_1 (IC5.34), STPMotorControl2_1 (IC1.1)
NFAULT_DRV1: STPMotorControl_1 (IC5.1), STPMotorControl4_1 (IC3.26 R12.2)
NHOME_DRV1: STPMotorControl_1 (IC5.22), STPMotorControl4_1 (IC3.27 R13.2)
OSC_IN: STPMotorControl_1 (IC5.5), STPMotorControl3_1 (R9.2)
OSC_OUT: STPMotorControl_1 (IC5.6), STPMotorControl3_1 (R10.1)
RESET: STPMotorControl_1 (IC5.7 J1.3), STPMotorControl3_1 (C28.2 D4.2 R11.1 SW1.1)
SPI2_MISO: STPMotorControl_1 (IC5.38), STPMotorControl4_1 (IC3.36)
SPI2_MOSI: STPMotorControl_1 (IC5.41), STPMotorControl4_1 (IC3.37)
SPI2_NSS_DRV1: STPMotorControl_1 (IC5.58), STPMotorControl4_1 (IC3.34)
SPI2_SCK: STPMotorControl_1 (IC5.42), STPMotorControl4_1 (IC3.38)
TIM2_CH1_STEP: STPMotorControl_1 (IC5.50), STPMotorControl4_1 (IC3.39)
TIM5_CH1_STEP: STPMotorControl_1 (IC5.56), STPMotorControl7_1 (P4.2)